# Altium project Martin_Smith_Project.PrjPcb (part 1 of 2)
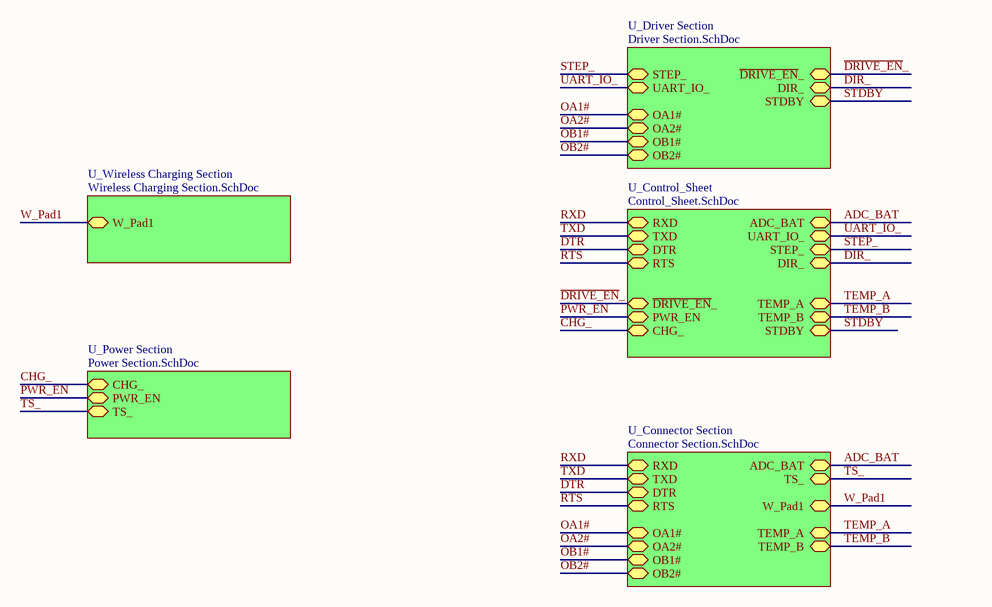
[diagram p0: Top Sheet.SchDoc]
6 sheets, 84 parts. Net scope: hierarchical (ports join the sheet entries above them; power ports are global).
Board file: MS_PCB.PcbDoc
Sheets:
  Top Sheet.SchDoc
    U_Power Section = Power Section.SchDoc
    U_Wireless Charging Section = Wireless Charging Section.SchDoc
    U_Connector Section = Connector Section.SchDoc
    U_Driver Section = Driver Section.SchDoc
    U_Control_Sheet = Control_Sheet.SchDoc

## Sheet Top Sheet.SchDoc
size A4; DocumentNumber: 1; SheetNumber: 1; SheetTotal: 6

### Sub-sheets
U_Connector Section = Connector Section.SchDoc: RXD (bidir), TXD (bidir), DTR (bidir), RTS (bidir), ADC_BAT (bidir), TS_ (bidir), W_Pad1 (bidir), TEMP_A (bidir), TEMP_B (bidir), OA2# (bidir), OB1# (bidir), OB2# (bidir), OA1# (bidir)
U_Control_Sheet = Control_Sheet.SchDoc: RXD (bidir), TXD (bidir), DTR (bidir), RTS (bidir), ADC_BAT (bidir), UART_IO_ (bidir), STEP_ (bidir), DIR_ (bidir), ~{DRI}~{VE_EN}_ (bidir), PWR_EN (bidir), CHG_ (bidir), TEMP_A (bidir), TEMP_B (bidir), STDBY (bidir)
U_Driver Section = Driver Section.SchDoc: STEP_ (bidir), DIR_ (bidir), UART_IO_ (bidir), ~{DRI}~{VE_EN}_ (bidir), STDBY (bidir), OB1# (bidir), OB2# (bidir), OA2# (bidir), OA1# (bidir)
U_Power Section = Power Section.SchDoc: PWR_EN (bidir), TS_ (bidir), CHG_ (bidir)
U_Wireless Charging Section = Wireless Charging Section.SchDoc: W_Pad1 (bidir)

### Nets
~{DRI}~{VE_EN}_: sheet U_Driver Section/~{DRI}~{VE_EN}_, sheet U_Control_Sheet/~{DRI}~{VE_EN}_
ADC_BAT: sheet U_Connector Section/ADC_BAT, sheet U_Control_Sheet/ADC_BAT
CHG_: sheet U_Power Section/CHG_, sheet U_Control_Sheet/CHG_
DIR_: sheet U_Driver Section/DIR_, sheet U_Control_Sheet/DIR_
DTR: sheet U_Connector Section/DTR, sheet U_Control_Sheet/DTR
OA1#: sheet U_Connector Section/OA1#, sheet U_Driver Section/OA1#
OA2#: sheet U_Connector Section/OA2#, sheet U_Driver Section/OA2#
OB1#: sheet U_Connector Section/OB1#, sheet U_Driver Section/OB1#
OB2#: sheet U_Connector Section/OB2#, sheet U_Driver Section/OB2#
PWR_EN: sheet U_Power Section/PWR_EN, sheet U_Control_Sheet/PWR_EN
RTS: sheet U_Connector Section/RTS, sheet U_Control_Sheet/RTS
RXD: sheet U_Connector Section/RXD, sheet U_Control_Sheet/RXD
STDBY: sheet U_Driver Section/STDBY, sheet U_Control_Sheet/STDBY
STEP_: sheet U_Driver Section/STEP_, sheet U_Control_Sheet/STEP_
TEMP_A: sheet U_Connector Section/TEMP_A, sheet U_Control_Sheet/TEMP_A
TEMP_B: sheet U_Connector Section/TEMP_B, sheet U_Control_Sheet/TEMP_B
TS_: sheet U_Power Section/TS_, sheet U_Connector Section/TS_
TXD: sheet U_Connector Section/TXD, sheet U_Control_Sheet/TXD
UART_IO_: sheet U_Driver Section/UART_IO_, sheet U_Control_Sheet/UART_IO_
W_Pad1: sheet U_Wireless Charging Section/W_Pad1, sheet U_Connector Section/W_Pad1

## Sheet Power Section.SchDoc
size A4; DocumentNumber: 2; SheetNumber: 2; SheetTotal: 6
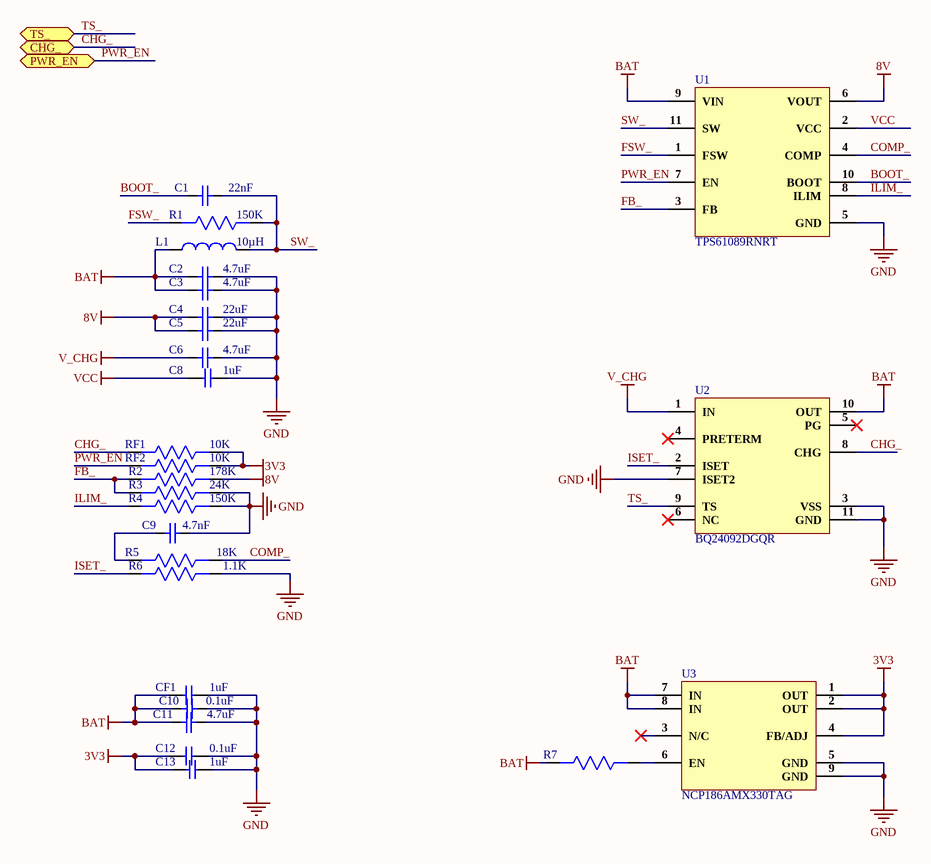
[diagram p1: Power Section.SchDoc]

### Parts
C1  22nF  [CAP 0201]
C2  4.7uF  [Cap0402]
C3  4.7uF  [Cap0402]
C4  22uF  [Cap0603]
C5  22uF  [Cap0603]
C6  4.7uF  [Cap0402]
C8  1uF  [CAP 0201]
C9  4.7nF  [Cap 0201]
C10  0.1uF  [CAP 0201]
C11  4.7uF  [Cap0402]
C12  0.1uF  [Cap 0201]
C13  1uF  [CAP 0201]
CF1  1uF  [Cap 0201]
L1  10µH  [SRN5040TA-100M]
R1  150K  [Res-0201]
R2  178K  [Res-0201]
R3  24K  [Res-0201]
R4  150K  [Res-0201]
R5  18K  [Res-0201]
R6  1.1K  [Res-0201]
R7  (no value)  [Res-0201]
RF1  10K  [Res-0201]
RF2  10K  [Res-0201]
U1  TPS61089RNRT  [TPS61089RNRT]
U2  BQ24092DGQR  [BQ24092DGQR]
U3  NCP186AMX330TAG  [NCP186AMX330TAG]

### Ports
CHG_ (bidir), PWR_EN (bidir), TS_ (bidir)

### Nets
3V3: C12.1 C13.1 RF1.1 RF2.1 U3.1(OUT) U3.2(OUT) U3.4(FB/ADJ)
8V: C4.2 C5.2 R2.1 U1.6(VOUT)
BAT: C2.2 C3.2 C10.2 C11.2 CF1.1 L1.1 R7.2 U1.9(VIN) U2.10(OUT) U3.7(IN) U3.8(IN)
GND: C2.1 C3.1 C4.1 C5.1 C6.1 C8.2 C9.1 C10.1 C11.1 C12.2 C13.2 CF1.2 R3.1 R4.1 R6.1 U1.5(GND) U2.3(VSS) U2.7(ISET2) U2.11(GND) U3.5(GND) U3.9(GND)
V_CHG: C6.2 U2.1(IN)
VCC: C8.1 U1.2(VCC)
BOOT_: C1.2 U1.10(BOOT)
CHG_: RF1.2 U2.8(CHG) ; port CHG_
COMP_: R5.1 U1.4(COMP)
FB_: R2.2 R3.2 U1.3(FB)
FSW_: R1.2 U1.1(FSW)
ILIM_: R4.2 U1.8(ILIM)
ISET_: R6.2 U2.2(ISET)
PWR_EN: RF2.2 U1.7(EN) ; port PWR_EN
SW_: C1.1 L1.2 R1.1 U1.11(SW)
TS_: U2.9(TS) ; port TS_
NetC9_2: C9.2 R5.2
NetR7_1: R7.1 U3.6(EN)

Not connected (* = marked no-connect by the designer): U2 4(PRETERM)* 5(PG)* 6(NC)*; U3 3(N/C)*

### Library data of the parts
C1 = TMK063BJ223KP-F: CAP CER 0.022UF 25V X5R 0201; Manufacturer: Taiyo Yuden; Tolerance: 10%; Supplier 1: Digi-Key; Manufacturer Part Number: TMK063BJ223KP-F; RoHS: No; Category: Ceramic Capacitors; Stock 1: 108943; Pricing 1: 1=0.10000, 10=0.02100, 50=0.01120, 100=0.00920, 500=0.00654, 1000=0.00514, 2500=0.00468, 5000=0.00430 (USD); Mount: Surface Mount; Case/Package: 0201; Case Code (Imperial): 0201; Case Code (Metric): 0603; Min Operating Temperature: -55°C; Max Operating Temperature: 85°C; Packaging: Tape and Reel; Capacitance: 22nF; Voltage Rating: 25V; ComponentLink1URL: https://ds.yuden.co.jp/TYCOMPAS/ut/detail?pn=TMK063BJ223KP-F &amp;u=M&src-supplier=Digi-Key; ComponentLink1Description: https://ds.yuden.co.jp/TYCOMPAS/ut/detail?pn=TMK063BJ223KP-F &amp;u=M&src-supplier=Digi-Key; ComponentLink2URL: http://ds.yuden.co.jp/TYCOMPAS/ut/detail.do?productNo=TMK063BJ223KP-F&amp;fileName=TMK063BJ223KP-F_SS&amp;mode=specSheetDownload&src-supplier=Digi-Key; ComponentLink2Description: http://ds.yuden.co.jp/TYCOMPAS/ut/detail.do?productNo=TMK063BJ223KP-F&amp;fileName=TMK063BJ223KP-F_SS&amp;mode=specSheetDownload&src-supplier=Digi-Key; Supplier Part Number 1: 587-6154-1-ND
C2 C3 C6 C11 = GRM155R61A475MEAAD: 0402 10 V 4.7 uF ±20% Tolerance X5R Multilayer Ceramic Chip Capacitor; Manufacturer: Murata; Voltage Rating: 10V; Supplier 1: Arrow Electronics; Manufacturer Part Number: GRM155R61A475MEAAD; Category: Ceramic Capacitors; Stock 1: 5; Pricing 1: 1=0.15280, 100000=0.02590, 1000000=0.02570, 10000000=0.02490 (USD); Mount: Surface Mount; Case/Package: 0402; Case Code (Imperial): 0402; Case Code (Metric): 1005; Min Operating Temperature: -55°C; Max Operating Temperature: 85°C; Packaging: Tape and Reel; Capacitance: 4.7uF; Tolerance: 20%; ComponentLink1URL: http://www.farnell.com/datasheets/2189109.pdf?src-supplier=Farnell; ComponentLink1Description: http://www.farnell.com/datasheets/2189109.pdf?src-supplier=Farnell; ComponentLink2URL: https://search.murata.co.jp/Ceramy/image/img/A01X/G101/ENG/GRM155R61A475MEAA-01.pdf?src-supplier=Digi-Key; ComponentLink2Description: https://search.murata.co.jp/Ceramy/image/img/A01X/G101/ENG/GRM155R61A475MEAA-01.pdf?src-supplier=Digi-Key; ComponentLink3URL: http://www.farnell.com/datasheets/2189109.pdf?src-supplier=Newark; ComponentLink3Description: http://www.farnell.com/datasheets/2189109.pdf?src-supplier=Newark; ComponentLink4URL: http://www.farnell.com/datasheets/2189109.pdf?src-supplier=Element14; ComponentLink4Description: http://www.farnell.com/datasheets/2189109.pdf?src-supplier=Element14; ComponentLink5URL: http://datasheet.octopart.com/GRM155R61A475MEAAD-Murata-datasheet-138740730.pdf?src-supplier=Ciiva+Crawler; ComponentLink5Description: http://datasheet.octopart.com/GRM155R61A475MEAAD-Murata-datasheet-138740730.pdf?src-supplier=Ciiva+Crawler; ComponentLink6URL: http://datasheet.octopart.com/GRM155R61A475MEAAD-Murata-datasheet-140690084.pdf?src-supplier=Ciiva+Crawler; ComponentLink6Description: http://datasheet.octopart.com/GRM155R61A475MEAAD-Murata-datasheet-140690084.pdf?src-supplier=Ciiva+Crawler; ComponentLink7URL: http://datasheet.octopart.com/GRM155R61A475MEAAD-Murata-datasheet-141266224.pdf?src-supplier=Ciiva+Crawler; ComponentLink7Description: http://datasheet.octopart.com/GRM155R61A475MEAAD-Murata-datasheet-141266224.pdf?src-supplier=Ciiva+Crawler; ComponentLink8URL: http://datasheet.octopart.com/GRM155R61A475MEAAD-Murata-datasheet-68589269.pdf?src-supplier=Newark; ComponentLink8Description: http://datasheet.octopart.com/GRM155R61A475MEAAD-Murata-datasheet-68589269.pdf?src-supplier=Newark; ComponentLink9URL: http://datasheet.octopart.com/GRM155R61A475MEAAD-Murata-datasheet-8819587.pdf; ComponentLink9Description: http://datasheet.octopart.com/GRM155R61A475MEAAD-Murata-datasheet-8819587.pdf; ComponentLink10URL: http://datasheet.octopart.com/GRM155R61A475MEAAD-Murata-datasheet-10025737.pdf; ComponentLink10Description: http://datasheet.octopart.com/GRM155R61A475MEAAD-Murata-datasheet-10025737.pdf; ComponentLink11URL: http://datasheet.octopart.com/GRM155R61A475MEAAD-Murata-datasheet-11978611.pdf; ComponentLink11Description: http://datasheet.octopart.com/GRM155R61A475MEAAD-Murata-datasheet-11978611.pdf; ComponentLink12URL: http://datasheet.octopart.com/GRM155R61A475MEAAD-Murata-datasheet-12510076.pdf; ComponentLink12Description: http://datasheet.octopart.com/GRM155R61A475MEAAD-Murata-datasheet-12510076.pdf; ComponentLink13URL: http://datasheet.octopart.com/GRM155R61A475MEAAD-Murata-datasheet-12515295.pdf; ComponentLink13Description: http://datasheet.octopart.com/GRM155R61A475MEAAD-Murata-datasheet-12515295.pdf; Supplier Part Number 1: GRM155R61A475MEAAD
C4 C5 = GRM187R61A226ME15D: CAP CER 22UF 10V X5R 0603; Manufacturer: Murata; Tolerance: 20%; Supplier 1: Digi-Key; Manufacturer Part Number: GRM187R61A226ME15D; RoHS: Yes; Category: Ceramic Capacitors; Stock 1: 93992; Pricing 1: 1=0.52000, 10=0.36500, 50=0.27580, 100=0.24030, 500=0.17798, 1000=0.15128 (USD); Mount: Surface Mount; Case/Package: 0603; Case Code (Imperial): 0603; Case Code (Metric): 1608; Min Operating Temperature: -55°C; Max Operating Temperature: 85°C; Dielectric: X5R; Voltage Rating (DC): 10V; Packaging: Tape and Reel; Capacitance: 22uF; Voltage Rating: 10V; Length: 0.063inch; Width: 0.031inch; Thickness: 0.031inch; ComponentLink1URL: http://search.murata.co.jp/Ceramy/image/img/A01X/G101/ENG/GRM187R61A226ME15-01.pdf?src-supplier=Digi-Key; ComponentLink1Description: http://search.murata.co.jp/Ceramy/image/img/A01X/G101/ENG/GRM187R61A226ME15-01.pdf?src-supplier=Digi-Key; Supplier Part Number 1: 490-13243-1-ND; RoHS Compliant: Yes
C8 C13 CF1 = CL03A105MO3NRNH: CAP CER 1UF 16V X5R 0201; Manufacturer: Samsung; Tolerance: 20%; Supplier 1: Digi-Key; Manufacturer Part Number: CL03A105MO3NRNH; RoHS: Yes; Category: Ceramic Capacitors; Mount: Surface Mount; Case/Package: 0201; Case Code (Metric): 0603; Case Code (Imperial): 0201; Min Operating Temperature: -55°C; Max Operating Temperature: 85°C; Packaging: Tape and Reel; Capacitance: 1uF; Voltage Rating: 16V; Length: 0.024inch; Width: 0.012inch; Thickness: 0.013inch; ComponentLink1URL: http://www.samsungsem.com/kr/support/product-search/mlcc/CL03A105MO3NRNH.jsp?src-supplier=Digi-Key; ComponentLink1Description: http://www.samsungsem.com/kr/support/product-search/mlcc/CL03A105MO3NRNH.jsp?src-supplier=Digi-Key; Supplier Part Number 1: 1276-6798-1-ND
  C8 C13: Stock 1: 66067; Pricing 1: 1=0.27000, 10=0.18500, 50=0.11080, 100=0.09360, 500=0.06406, 1000=0.05667, 2500=0.05421, 5000=0.04928 (USD); RoHS Compliant: Yes
  CF1: Stock 1: 1602977; Pricing 1: 1=0.28000, 10=0.19000, 50=0.11380, 100=0.09610, 500=0.06578, 1000=0.05819, 2500=0.05566, 5000=0.05060 (USD)
C9 = GRM033R61E472MA12D: CAP CER 4700PF 25V X5R 0201; Manufacturer: Murata; Tolerance: 20%; Supplier 1: Digi-Key; Manufacturer Part Number: GRM033R61E472MA12D; RoHS: Yes; Category: Ceramic Capacitors; Stock 1: 58014; Pricing 1: 1=0.10000, 10=0.01300, 50=0.00720, 100=0.00590, 500=0.00424, 1000=0.00333, 2500=0.00302, 5000=0.00278 (USD); Mount: Surface Mount; Case/Package: 0201; Case Code (Metric): 0603; Weight: 1.2E-05oz; Case Code (Imperial): 0201; Min Operating Temperature: -55°C; Max Operating Temperature: 85°C; Packaging: Tape and Reel; Voltage Rating: 25V; Capacitance: 4.7nF; Dielectric: X5R; Termination: SMD/SMT; Voltage Rating (DC): 25V; Package Quantity: 15000; Length: 0.024inch; Width: 0.3mm; Height: 0.3mm; Thickness: 0.013inch; ComponentLink1URL: http://www.mouser.com/ds/2/281/c02e-2905.pdf?src-supplier=Mouser; ComponentLink1Description: http://www.mouser.com/ds/2/281/c02e-2905.pdf?src-supplier=Mouser; ComponentLink2URL: http://search.murata.co.jp/Ceramy/image/img/A01X/partnumbering_e_01.pdf?src-supplier=Digi-Key; ComponentLink2Description: http://search.murata.co.jp/Ceramy/image/img/A01X/partnumbering_e_01.pdf?src-supplier=Digi-Key; ComponentLink3URL: http://search.murata.co.jp/Ceramy/image/img/A01X/G101/ENG/GRM033R61E472MA12-01.pdf?src-supplier=Digi-Key; ComponentLink3Description: http://search.murata.co.jp/Ceramy/image/img/A01X/G101/ENG/GRM033R61E472MA12-01.pdf?src-supplier=Digi-Key; Supplier Part Number 1: 490-9994-1-ND
C10 = GRM033R6YA104ME14D: CAP CER 0.1UF 35V X5R 0201; Manufacturer: Murata; Capacitance: 100nF; Tolerance: 20%; Supplier 1: Digi-Key; Manufacturer Part Number: GRM033R6YA104ME14D; RoHS: Yes; Category: Ceramic Capacitors; Stock 1: 173583; Pricing 1: 1=0.10000, 10=0.05100, 50=0.02780, 100=0.02260, 500=0.01616, 1000=0.01270, 2500=0.01155, 5000=0.01063 (USD); Mount: Surface Mount; Case/Package: 0201; Case Code (Metric): 0603; Case Code (Imperial): 0201; Weight: 1.2E-05oz; Min Operating Temperature: -55°C; Max Operating Temperature: 85°C; Packaging: Tape and Reel; Voltage Rating: 35V; Dielectric: X5R; Termination: SMD/SMT; Voltage Rating (DC): 35V; Package Quantity: 15000; Length: 0.024inch; Width: 0.012inch; Height: 0.3mm; Thickness: 0.013inch; RoHS Compliant: Yes; ComponentLink1URL: http://www.mouser.com/ds/2/281/c02e-2905.pdf?src-supplier=Mouser; ComponentLink1Description: http://www.mouser.com/ds/2/281/c02e-2905.pdf?src-supplier=Mouser; ComponentLink2URL: http://search.murata.co.jp/Ceramy/image/img/A01X/G101/ENG/GRM033R6YA104ME14-01.pdf?src-supplier=Digi-Key; ComponentLink2Description: http://search.murata.co.jp/Ceramy/image/img/A01X/G101/ENG/GRM033R6YA104ME14-01.pdf?src-supplier=Digi-Key; Supplier Part Number 1: 490-10431-1-ND
C12 = GRM033R6YA104ME14D: CAP CER 0.1UF 35V X5R 0201; Manufacturer: Murata; Tolerance: 20%; Capacitance: 100nF; Supplier 1: Digi-Key; Manufacturer Part Number: GRM033R6YA104ME14D; RoHS: Yes; Category: Ceramic Capacitors; Stock 1: 49800; Pricing 1: 1=0.10000, 10=0.05600, 50=0.03040, 100=0.02490, 500=0.01778, 1000=0.01398, 2500=0.01270, 5000=0.01169 (USD); Mount: Surface Mount; Case/Package: 0201; Weight: 1.2E-05oz; Case Code (Metric): 0603; Case Code (Imperial): 0201; Min Operating Temperature: -55°C; Max Operating Temperature: 85°C; Dielectric: X5R; Termination: SMD/SMT; Voltage Rating (DC): 35V; Package Quantity: 15000; Packaging: Tape and Reel; Voltage Rating: 35V; Length: 0.024inch; Height: 0.3mm; Width: 0.012inch; Thickness: 0.013inch; ComponentLink1URL: http://www.mouser.com/ds/2/281/c02e-2905.pdf?src-supplier=Mouser; ComponentLink1Description: http://www.mouser.com/ds/2/281/c02e-2905.pdf?src-supplier=Mouser; ComponentLink2URL: http://search.murata.co.jp/Ceramy/image/img/A01X/G101/ENG/GRM033R6YA104ME14-01.pdf?src-supplier=Digi-Key; ComponentLink2Description: http://search.murata.co.jp/Ceramy/image/img/A01X/G101/ENG/GRM033R6YA104ME14-01.pdf?src-supplier=Digi-Key; Supplier Part Number 1: 490-10431-1-ND
L1 = SRN5040TA-100M: Ind Power Wirewound 10uH 20% Ferrite Core T/R; Manufacturer: Bourns; Current Rating: 2.2A; Saturation Current: 2.52A; Shielding: Shielded; DC Resistance (DCR): 56mR; Self Resonant Frequency: 26MHz; Test Frequency: 100kHz; Supplier 1: Digi-Key; Manufacturer Part Number: SRN5040TA-100M; RoHS: No; Category: Fixed Inductors; Stock 1: 1454; Pricing 1: 1=0.52000, 10=0.45500, 25=0.42240, 50=0.35760, 100=0.32500, 250=0.30552, 500=0.27300 (USD); Mount: Surface Mount; Case/Package: Nonstandard; Core Material: Ferrite; Min Operating Temperature: -55°C; Max Operating Temperature: 125°C; Resistor Type: Wirewound; Packaging: Cut Tape; Inductance: 10uH; Tolerance: 20%; Ratings: AEC-Q200; ComponentLink1URL: http://www.farnell.com/datasheets/2675147.pdf?src-supplier=Farnell; ComponentLink1Description: http://www.farnell.com/datasheets/2675147.pdf?src-supplier=Farnell; ComponentLink2URL: https://www.bourns.com/docs/Product-Datasheets/SRN5040TA.pdf?src-supplier=Digi-Key; ComponentLink2Description: https://www.bourns.com/docs/Product-Datasheets/SRN5040TA.pdf?src-supplier=Digi-Key; ComponentLink3URL: http://www.farnell.com/datasheets/2675147.pdf?src-supplier=Newark; ComponentLink3Description: http://www.farnell.com/datasheets/2675147.pdf?src-supplier=Newark; Supplier Part Number 1: SRN5040TA-100MCT-ND
R1 R4 = RMCF0201FT150K: RES 150K OHM 1% 1/20W 0201; Manufacturer: Stackpole Electronics; Resistance: 150kR; Power Rating: 50mW; Temperature Coefficient: 200ppm/°C; Supplier 1: Digi-Key; Manufacturer Part Number: RMCF0201FT150K; RoHS: Yes; Category: Chip SMD Resistors; Stock 1: 71595; Pricing 1: 1=0.10000, 10=0.02300, 100=0.00940, 1000=0.00424, 2500=0.00368, 5000=0.00304 (USD); Mount: Surface Mount; Case/Package: 0201; Case Code (Metric): 0603; Case Code (Imperial): 0201; Contact Plating: Tin,Matte; Min Operating Temperature: -55°C; Max Operating Temperature: 125°C; Resistor Type: Thick Film; Package Quantity: 10000; Packaging: Tape and Reel; Tolerance: 1%; Number of Terminations: 2; Max Power Dissipation: 50mW; Length: 0.024inch; Width: 0.012inch; Height: 0.009inch; Radiation Hardening: No; ComponentLink1URL: https://www.seielect.com/catalog/SEI-RMCF_RMCP.pdf?src-supplier=Avnet+Asia; ComponentLink1Description: https://www.seielect.com/catalog/SEI-RMCF_RMCP.pdf?src-supplier=Avnet+Asia; ComponentLink2URL: https://www.seielect.com/catalog/SEI-RMCF_RMCP.pdf?src-supplier=Avnet; ComponentLink2Description: https://www.seielect.com/catalog/SEI-RMCF_RMCP.pdf?src-supplier=Avnet; ComponentLink3URL: http://www.seielect.com/Catalog/SEI-RMCF_RMCP.pdf?src-supplier=Digi-Key; ComponentLink3Description: http://www.seielect.com/Catalog/SEI-RMCF_RMCP.pdf?src-supplier=Digi-Key; ComponentLink4URL: https://www.seielect.com/Catalog/SEI-RMCF_RMCP.pdf?src-supplier=Digi-Key; ComponentLink4Description: https://www.seielect.com/Catalog/SEI-RMCF_RMCP.pdf?src-supplier=Digi-Key; ComponentLink5URL: https://www.seielect.com/catalog/SEI-Packaging.pdf?src-supplier=Digi-Key; ComponentLink5Description: https://www.seielect.com/catalog/SEI-Packaging.pdf?src-supplier=Digi-Key; Supplier Part Number 1: RMCF0201FT150KCT-ND
R2 = RC0201FR-07178KL: RES SMD 178K OHM 1% 1/20W 0201; Manufacturer: Yageo; Max Power Dissipation: 50mW; Temperature Coefficient: 200ppm/°C; Resistance: 178kR; Supplier 1: Digi-Key; Manufacturer Part Number: RC0201FR-07178KL; RoHS: Yes; Category: Chip SMD Resistors; Stock 1: 50010; Pricing 1: 1=0.10000, 10=0.03600, 100=0.01480, 1000=0.00665, 2500=0.00577, 5000=0.00477 (USD); Case/Package: 0201; Case Code (Imperial): 0201; Case Code (Metric): 0603; Min Operating Temperature: -55°C; Max Operating Temperature: 125°C; Tolerance: 1%; Packaging: Tape and Reel; Resistor Type: Thick Film; Number of Terminations: 2; Features: Moisture Resistant; Length: 0.024inch; Width: 0.012inch; Height: 0.01inch; ComponentLink1URL: http://www.yageo.com/documents/recent/PYu-RC_Group_51_RoHS_L_9.pdf?src-supplier=Digi-Key; ComponentLink1Description: http://www.yageo.com/documents/recent/PYu-RC_Group_51_RoHS_L_9.pdf?src-supplier=Digi-Key; ComponentLink2URL: http://www.yageo.com.tw/exep/pages/download/literatures/PYu-R_INT-thick_7.pdf?src-supplier=Digi-Key; ComponentLink2Description: http://www.yageo.com.tw/exep/pages/download/literatures/PYu-R_INT-thick_7.pdf?src-supplier=Digi-Key; Supplier Part Number 1: YAG2443CT-ND
R3 = RC0201JR-0724KL: RES SMD 24K OHM 5% 1/20W 0201; Manufacturer: Yageo; Power Rating: 50mW; Voltage Rating: 25V; Temperature Coefficient: 200ppm/°C; Resistance: 24kR; Supplier 1: Digi-Key; Manufacturer Part Number: RC0201JR-0724KL; RoHS: Yes; Category: Chip SMD Resistors; Stock 1: 16082; Pricing 1: 1=0.10000, 10=0.02600, 100=0.01040, 1000=0.00466, 2500=0.00405, 5000=0.00334 (USD); Case/Package: 0201; Weight: 6E-06oz; Case Code (Metric): 0603; Case Code (Imperial): 0201; Min Operating Temperature: -55°C; Max Operating Temperature: 125°C; Tolerance: 5%; Packaging: Tape and Reel; Termination: SMD/SMT; Length: 0.6mm; Width: 0.3mm; Height: 0.23mm; ComponentLink1URL: http://www.mouser.com/ds/2/447/PYu-RC_Group_51_RoHS_L_7-1101646.pdf?src-supplier=Mouser; ComponentLink1Description: http://www.mouser.com/ds/2/447/PYu-RC_Group_51_RoHS_L_7-1101646.pdf?src-supplier=Mouser; ComponentLink2URL: http://www.yageo.com/documents/recent/PYu-RC_Group_51_RoHS_L_10.pdf?src-supplier=Digi-Key; ComponentLink2Description: http://www.yageo.com/documents/recent/PYu-RC_Group_51_RoHS_L_10.pdf?src-supplier=Digi-Key; ComponentLink3URL: http://www.yageo.com/documents/recent/PYu-RC_Group_51_RoHS_L_9.pdf?src-supplier=Digi-Key; ComponentLink3Description: http://www.yageo.com/documents/recent/PYu-RC_Group_51_RoHS_L_9.pdf?src-supplier=Digi-Key; Supplier Part Number 1: 311-24KNCT-ND
R5 = RC0201FR-0718KL: RES SMD 18K OHM 1% 1/20W 0201; Manufacturer: Yageo; Resistance: 18kR; Power Rating: 50mW; Voltage Rating: 25V; Temperature Coefficient: 200ppm/°C; Supplier 1: Digi-Key; Manufacturer Part Number: RC0201FR-0718KL; RoHS: Yes; Category: Chip SMD Resistors; Stock 1: 12981; Pricing 1: 1=0.10000, 10=0.03600, 100=0.01480, 1000=0.00665, 2500=0.00577, 5000=0.00477 (USD); Case/Package: 0201; Case Code (Metric): 0603; Case Code (Imperial): 0201; Min Operating Temperature: -55°C; Max Operating Temperature: 125°C; Features: Moisture Resistant; Tolerance: 1%; Package Quantity: 1; Packaging: Tape and Reel; Max Power Dissipation: 50mW; Resistor Type: Thick Film; Number of Terminations: 2; Termination: SMD/SMT; Length: 0.024inch; Width: 0.012inch; Height: 0.01inch; Lead Free: Lead Free; REACH SVHC: No SVHC; ComponentLink1URL: https://datasheet.ciiva.com/2493/pyu-r-int-thick-7-2493817.pdf?src-supplier=Digi-Key; ComponentLink1Description: https://datasheet.ciiva.com/2493/pyu-r-int-thick-7-2493817.pdf?src-supplier=Digi-Key; ComponentLink2URL: https://datasheet.ciiva.com/2493/pyu-r-int-thick-7-2493818.pdf?src-supplier=Digi-Key; ComponentLink2Description: https://datasheet.ciiva.com/2493/pyu-r-int-thick-7-2493818.pdf?src-supplier=Digi-Key; ComponentLink3URL: https://datasheet.ciiva.com/2493/pyu-r-int-thick-7-2493819.pdf?src-supplier=Digi-Key; ComponentLink3Description: https://datasheet.ciiva.com/2493/pyu-r-int-thick-7-2493819.pdf?src-supplier=Digi-Key; ComponentLink4URL: https://datasheet.ciiva.com/22661/1563626-22661291.pdf?src-supplier=Element14; ComponentLink4Description: https://datasheet.ciiva.com/22661/1563626-22661291.pdf?src-supplier=Element14; Supplier Part Number 1: 311-18.0KMCT-ND
R6 = RC0201FR-071K1L: RES SMD 1.1K OHM 1% 1/20W 0201; Manufacturer: Yageo; Resistance: 1.1kR; Power Rating: 50mW; Temperature Coefficient: 200ppm/°C; Supplier 1: Digi-Key; Manufacturer Part Number: RC0201FR-071K1L; RoHS: Yes; Category: Chip SMD Resistors; Stock 1: 18736; Pricing 1: 1=0.10000, 10=0.03600, 100=0.01480, 1000=0.00665, 2500=0.00577, 5000=0.00477 (USD); Case/Package: 0201; Case Code (Metric): 0603; Case Code (Imperial): 0201; Min Operating Temperature: -55°C; Max Operating Temperature: 125°C; Tolerance: 1%; Packaging: Tape and Reel; Resistor Type: Thick Film; Number of Terminations: 2; Max Power Dissipation: 50mW; Features: Moisture Resistant; Length: 0.024inch; Width: 0.012inch; Height: 0.01inch; Lead Free: Lead Free; ComponentLink1URL: http://www.yageo.com/documents/recent/PYu-RC0201_51_RoHS_L_(8).pdf?src-supplier=Future+Electronics; ComponentLink1Description: http://www.yageo.com/documents/recent/PYu-RC0201_51_RoHS_L_(8).pdf?src-supplier=Future+Electronics; ComponentLink2URL: http://www.yageo.com.tw/exep/pages/download/literatures/PYu-R_INT-thick_7.pdf?src-supplier=Digi-Key; ComponentLink2Description: http://www.yageo.com.tw/exep/pages/download/literatures/PYu-R_INT-thick_7.pdf?src-supplier=Digi-Key; ComponentLink3URL: http://www.yageo.com/documents/recent/PYu-RC_Group_51_RoHS_L_9.pdf?src-supplier=Digi-Key; ComponentLink3Description: http://www.yageo.com/documents/recent/PYu-RC_Group_51_RoHS_L_9.pdf?src-supplier=Digi-Key; Supplier Part Number 1: YAG2474CT-ND
R7 RF1 RF2 = RC0201JR-0710KL: RES SMD 10K OHM 5% 1/20W 0201; Manufacturer: Yageo; Voltage Rating (DC): 25V; Power Rating: 50mW; Resistance: 10kR; Temperature Coefficient: 200ppm/°C; Case Code (Imperial): 0201; Case Code (Metric): 0603; Case/Package: 0201; Category: Chip SMD Resistors; Contact Plating: Tin,Matte; Depth: 0.3mm; Lead Free: Lead Free; Length: 0.6mm; Manufacturer Part Number: RC0201JR-0710KL; Max Operating Temperature: 125°C; Military Standard: Not; Min Operating Temperature: -55°C; Packaging: Tape and Reel; Radiation Hardening: No; REACH SVHC: Unknown; Resistor Type: Thick Film; Termination: SMD/SMT; Tolerance: 5%; Voltage Rating: 25V; ComponentLink1Description: New link; ComponentLink1URL: *; Supplier 1: Digi-Key; RoHS: Yes; Stock 1: 1488597; Pricing 1: 1=0.10000, 10=0.02600, 100=0.01050, 1000=0.00472, 2500=0.00410, 5000=0.00338 (USD); ComponentLink2URL: https://datasheet.ciiva.com/8891/pyu-rc0201-51-rohs-l-8-8891388.pdf?src-supplier=Avnet; ComponentLink2Description: https://datasheet.ciiva.com/8891/pyu-rc0201-51-rohs-l-8-8891388.pdf?src-supplier=Avnet; ComponentLink3URL: https://datasheet.ciiva.com/7672/1563626-7672253.pdf?src-supplier=Element14; ComponentLink3Description: https://datasheet.ciiva.com/7672/1563626-7672253.pdf?src-supplier=Element14; ComponentLink4URL: https://datasheet.ciiva.com/28405/pyu-rc0201-51-rohs-l-8-28405613.pdf?src-supplier=Avnet+Europe; ComponentLink4Description: https://datasheet.ciiva.com/28405/pyu-rc0201-51-rohs-l-8-28405613.pdf?src-supplier=Avnet+Europe; ComponentLink5URL: https://datasheet.ciiva.com/7672/1563626-7672254.pdf?src-supplier=Element14; ComponentLink5Description: https://datasheet.ciiva.com/7672/1563626-7672254.pdf?src-supplier=Element14; ComponentLink6URL: https://datasheet.ciiva.com/7660/1421516-7660810.pdf?src-supplier=Element14; ComponentLink6Description: https://datasheet.ciiva.com/7660/1421516-7660810.pdf?src-supplier=Element14; ComponentLink7URL: https://datasheet.ciiva.com/16856/pyu-rc0201-51-rohs-l-8-16856011.pdf?src-supplier=Avnet+Europe; ComponentLink7Description: https://datasheet.ciiva.com/16856/pyu-rc0201-51-rohs-l-8-16856011.pdf?src-supplier=Avnet+Europe; ComponentLink8URL: https://datasheet.ciiva.com/46391/1421516-46391291.pdf?src-supplier=Element14; ComponentLink8Description: https://datasheet.ciiva.com/46391/1421516-46391291.pdf?src-supplier=Element14; Supplier Part Number 1: 311-10KNCT-ND
U1 = TPS61089RNRT: IC REG BOOST ADJ 7A 11VQFN; Manufacturer: Texas Instruments; Quiescent Current: 10uA; Supplier 1: Digi-Key; Manufacturer Part Number: TPS61089RNRT; RoHS: No; Category: Voltage Regulators - Switching; Pricing 1: 1=2.95000, 10=2.64900, 25=2.50440, 100=2.05910 (USD); Min Operating Temperature: -40°C; Max Operating Temperature: 85°C; Topology: Boost; Lead Free: Lead Free; ComponentLink1URL: http://www.ti.com/lit/ds/symlink/tps61089.pdf?src-supplier=Digi-Key; ComponentLink1Description: http://www.ti.com/lit/ds/symlink/tps61089.pdf?src-supplier=Digi-Key; ComponentLink2URL: http://www.ti.com/general/docs/suppproductinfo.tsp?distId=10&amp;gotoUrl=http%3A%2F%2Fwww.ti.com%2Flit%2Fgpn%2Ftps61089&src-supplier=Digi-Key; ComponentLink2Description: http://www.ti.com/general/docs/suppproductinfo.tsp?distId=10&amp;gotoUrl=http%3A%2F%2Fwww.ti.com%2Flit%2Fgpn%2Ftps61089&src-supplier=Digi-Key; Supplier Part Number 1: 296-46242-1-ND
U2 = BQ24092DGQR: IC BATT CHG LI-ION 1CELL 10MSOP; Manufacturer: Texas Instruments; Output Current: 1A; Min Supply Voltage: 3.5V; Max Supply Voltage: 6.45V; Output Voltage: 4.2V; Min Input Voltage: 4.5V; Number of Cells: 1; Interface: USB; Fault Protection: Over Voltage,Over Temperature,Short Circuit; Supplier 1: Digi-Key; Manufacturer Part Number: BQ24092DGQR; RoHS: Yes; Category: Battery Management; Stock 1: 52631; Pricing 1: 1=1.29000, 10=1.15100, 25=1.09200, 100=0.83850, 250=0.74100, 500=0.70200, 1000=0.54600 (USD); Case/Package: HTSSOP EP; Number of Pins: 10; Contact Plating: Gold; Min Operating Temperature: -40°C; Max Operating Temperature: 125°C; Packaging: Tape and Reel; Package Quantity: 2500; Max Charge Current: 1A; Battery Pack Voltage: 4.2V; Radiation Hardening: No; Lead Free: Lead Free; ComponentLink1URL: https://datasheet.ciiva.com/15114/getdatasheetpartid-516671-15114858.pdf?src-supplier=Verical; ComponentLink1Description: https://datasheet.ciiva.com/15114/getdatasheetpartid-516671-15114858.pdf?src-supplier=Verical; ComponentLink2URL: https://datasheet.ciiva.com/1934/bq24092-1934314.pdf?src-supplier=Digi-Key; ComponentLink2Description: https://datasheet.ciiva.com/1934/bq24092-1934314.pdf?src-supplier=Digi-Key; ComponentLink3URL: https://datasheet.ciiva.com/3214/bq24092-3214092.pdf?src-supplier=Avnet; ComponentLink3Description: https://datasheet.ciiva.com/3214/bq24092-3214092.pdf?src-supplier=Avnet; Supplier Part Number 1: 296-41204-1-ND
U3 = NCP186AMX330TAG: IC REG LINEAR 3.3V 1A 8XDFN; Manufacturer: ON Semiconductor; Dropout Voltage: 95mV; Number of Regulators: 1; Min Current Limit: 1.1A; Supplier 1: Digi-Key; Manufacturer Part Number: NCP186AMX330TAG; Stock 1: 5995; Pricing 1: 1=0.48, 10=0.39, 25=0.3564, 100=0.2405, 250=0.199, 500=0.18242, 1000=0.13682 (USD); Mount: Surface Mount; Number of Pins: 8; Min Operating Temperature: -40°C; Max Operating Temperature: 125°C; Packaging: Tape and Reel; Output Voltage: 3.3V; Output Current: 1A; Lead Free: Lead Free; ComponentLink1URL: http://www.farnell.com/datasheets/2236905.pdf?src-supplier=Farnell; ComponentLink1Description: http://www.farnell.com/datasheets/2236905.pdf?src-supplier=Farnell; ComponentLink2URL: http://www.farnell.com/datasheets/2236905.pdf?src-supplier=Newark; ComponentLink2Description: http://www.farnell.com/datasheets/2236905.pdf?src-supplier=Newark; ComponentLink3URL: http://www.onsemi.com/pub/Collateral/NCP186-D.PDF?src-supplier=Digi-Key; ComponentLink3Description: http://www.onsemi.com/pub/Collateral/NCP186-D.PDF?src-supplier=Digi-Key; ComponentLink4URL: https://www.onsemi.com/pub/Collateral/NCP186-D.PDF?src-supplier=Digi-Key; ComponentLink4Description: https://www.onsemi.com/pub/Collateral/NCP186-D.PDF?src-supplier=Digi-Key; Supplier Part Number 1: NCP186AMX330TAGOSCT-ND

## Sheet Wireless Charging Section.SchDoc
size A; DocumentNumber: 3; SheetNumber: 3; SheetTotal: 6
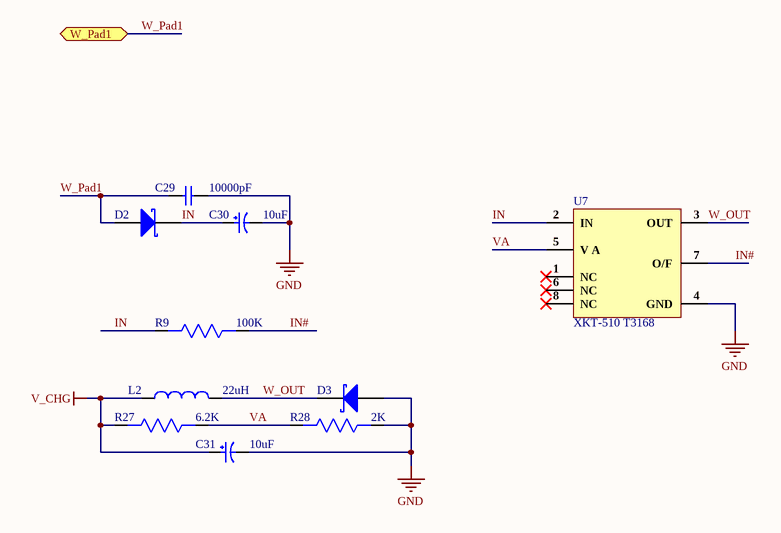
[diagram p2: Wireless Charging Section.SchDoc]

### Parts
C29  10000pF  [CAP 0201]
C30  10uF  [Cap Case-C]
C31  10uF  [Cap Case-C]
D2  SS34  [SMC]  (value not drawn)
D3  SS34  [SMC]  (value not drawn)
L2  22uH  [SRU8028-220Y]
R9  100K  [Res-0201]
R27  6.2K  [Res-0201]
R28  2K  [Res-0201]
U7  XKT-510 T3168  [SOP-8]

### Ports
W_Pad1 (bidir)

### Nets
GND: C29.2 C30.1 C31.1 D3.1(A) R28.1 U7.4(GND)
V_CHG: C31.2 L2.1 R27.2
IN: C30.2 D2.2(K) R9.2 U7.2(IN)
IN#: R9.1 U7.7(O/F)
VA: R27.1 R28.2 U7.5(V_A)
W_OUT: D3.2(K) L2.2 U7.3(OUT)
W_Pad1: C29.1 D2.1(A) ; port W_Pad1

Not connected (* = marked no-connect by the designer): U7 1(NC)* 6(NC)* 8(NC)*

### Library data of the parts
C29 = CC0201KRX7R8BB103: CAP CER X7R 0201; Manufacturer: Yageo; Supplier 1: Digi-Key; Manufacturer Part Number: CC0201KRX7R8BB103; RoHS: Yes; Stock 1: 19600; Pricing 1: 1=0.10000, 10=0.02800, 50=0.01520, 100=0.01240, 500=0.00886, 1000=0.00696, 2500=0.00632, 5000=0.00582 (USD); RoHS Compliant: Yes; Supplier Part Number 1: 13-CC0201KRX7R8BB103CT-ND
C30 C31 = 293D106X0025C2TE3: CAP TANT 10UF 20% 25V 2312; Manufacturer: Vishay Sprague; Dielectric Material: Tantalum; ESR (Equivalent Series Resistance): 1.5R; Ripple Current: 190mA; Leakage Current: 2.5uA; Polarity: Polar; Dissipation Factor: 6%; Supplier 1: Digi-Key; Manufacturer Part Number: 293D106X0025C2TE3; RoHS: Yes; Category: Tantalum Capacitors; Stock 1: 14194; Pricing 1: 1=0.45000, 10=0.31600, 50=0.23920, 100=0.20840 (USD); Mount: Surface Mount,PCB; Case/Package: Molded; Number of Pins: 2; Case Code (Metric): 6032; Case Code (Imperial): 2312; Min Operating Temperature: -55°C; Max Operating Temperature: 125°C; Capacitance: 10uF; Tolerance: 20%; Package Quantity: 1; Voltage Rating: 25V; Packaging: Tape and Reel; Voltage Rating (DC): 25V; Termination: SMD/SMT; Features: General Purpose; Series: TANTAMOUNT® 293D; Construction: Flat; Length: 6mm; Width: 0.126inch; Height: 2.5mm; Depth: 3.2mm; Height - Seated (Max): 0.11inch; Radiation Hardening: No; REACH SVHC: Unknown; Lead Free: Lead Free; RoHS Compliant: Yes; ComponentLink1URL: https://datasheet.ciiva.com/258/293d-258835.pdf?src-supplier=Digi-Key; ComponentLink1Description: https://datasheet.ciiva.com/258/293d-258835.pdf?src-supplier=Digi-Key; ComponentLink2URL: https://datasheet.ciiva.com/15163/getdatasheetpartid-87477-15163227.pdf?src-supplier=Verical; ComponentLink2Description: https://datasheet.ciiva.com/15163/getdatasheetpartid-87477-15163227.pdf?src-supplier=Verical; ComponentLink3URL: https://datasheet.ciiva.com/16508/293d-16508059.pdf?src-supplier=Future+Electronics; ComponentLink3Description: https://datasheet.ciiva.com/16508/293d-16508059.pdf?src-supplier=Future+Electronics; ComponentLink4URL: https://datasheet.ciiva.com/3003/293d-3003820.pdf?src-supplier=Avnet; ComponentLink4Description: https://datasheet.ciiva.com/3003/293d-3003820.pdf?src-supplier=Avnet; ComponentLink5URL: https://datasheet.ciiva.com/18444/70212567-18444876.pdf?src-supplier=Allied+Electronics; ComponentLink5Description: https://datasheet.ciiva.com/18444/70212567-18444876.pdf?src-supplier=Allied+Electronics; ComponentLink6URL: https://datasheet.ciiva.com/46382/1796648-46382044.pdf?src-supplier=Element14; ComponentLink6Description: https://datasheet.ciiva.com/46382/1796648-46382044.pdf?src-supplier=Element14; ComponentLink7URL: https://datasheet.ciiva.com/11244/293d-11244094.pdf?src-supplier=Avnet; ComponentLink7Description: https://datasheet.ciiva.com/11244/293d-11244094.pdf?src-supplier=Avnet; ComponentLink8URL: https://datasheet.ciiva.com/16631/293d-16631759.pdf?src-supplier=Avnet+Europe; ComponentLink8Description: https://datasheet.ciiva.com/16631/293d-16631759.pdf?src-supplier=Avnet+Europe; ComponentLink9URL: https://datasheet.ciiva.com/258/293d-258834.pdf?src-supplier=Digi-Key; ComponentLink9Description: https://datasheet.ciiva.com/258/293d-258834.pdf?src-supplier=Digi-Key; ComponentLink10URL: https://datasheet.ciiva.com/258/293d-258836.pdf?src-supplier=Digi-Key; ComponentLink10Description: https://datasheet.ciiva.com/258/293d-258836.pdf?src-supplier=Digi-Key; ComponentLink11URL: https://datasheet.ciiva.com/12884/293d-239871-12884366.pdf?src-supplier=Mouser; ComponentLink11Description: https://datasheet.ciiva.com/12884/293d-239871-12884366.pdf?src-supplier=Mouser; Supplier Part Number 1: 718-1044-1-ND
D2 D3 = SS34: DIODE SCHOTTKY 40V 3A DO214AB; Manufacturer: Vishay Semiconductors; Manufacturer Part Number: SS34-E3/57T; Element Configuration: Single; Max Forward Surge Current (Ifsm): 100A; Max Reverse Current: 500uA; Forward Voltage: 500mV; Polarity: Standard; Supplier 1: Digi-Key; RoHS: Yes; Category: Rectifier Diodes; Stock 1: 17665; Pricing 1: 1=0.53000, 10=0.45400, 100=0.31530 (USD); Mount: Surface Mount; Case/Package: SMC; Number of Pins: 2; Contact Plating: Tin,Matte; Min Operating Temperature: -55°C; Max Operating Temperature: 125°C; Packaging: Tape and Reel; Package Quantity: 1; Max Repetitive Reverse Voltage (Vrrm): 40V; Current Rating: 3A; Forward Current: 3A; Voltage Rating (DC): 40V; Output Current: 3A; Peak Non-Repetitive Surge Current: 100A; Average Rectified Current: 3A; Max Reverse Voltage (DC): 40V; Max Surge Current: 100A; Max Reverse Leakage Current: 500uA; Current: 3A; Voltage: 40V; Length: 7.11mm; Width: 6.22mm; Height: 2.417mm; Radiation Hardening: No; REACH SVHC: Unknown; Lead Free: Lead Free; Supplier Part Number 1: SS34-E3/57TGICT-ND
L2 = SRU8028-220Y: FIXED IND 22UH 1.6A 106 MOHM SMD; Manufacturer: Bourns; Core Material: Ferrite; Tolerance: 30%; DC Resistance (DCR): 106mR; Self Resonant Frequency: 20MHz; Saturation Current: 1.5A; Shielding: Shielded; Test Frequency: 100kHz; Q Factor: 22; Current: 2.8A; Supplier 1: Digi-Key; Manufacturer Part Number: SRU8028-220Y; RoHS: Yes; Category: Fixed Inductors; Stock 1: 1920; Pricing 1: 1=0.92000, 10=0.85800, 25=0.79200, 50=0.66000, 100=0.62040, 250=0.55440, 500=0.47520 (USD); Mount: Surface Mount; Case/Package: 8028; Number of Pins: 2; Min Operating Temperature: -40°C; Max Operating Temperature: 125°C; Inductance: 22uH; Max DC Current: 1.6A; Packaging: Tape and Reel; Inductance Tolerance: 30%; Package Quantity: 1500; Current Rating: 1.6A; Resistor Type: Wirewound; RMS Current (Irms): 1.6A; Termination: SMD/SMT; DC Current: 1.6A; Series: SRU8028; Length: 0.315inch; Width: 0.315inch; Height: 2.8mm; Height - Seated (Max): 0.122inch; Depth: 8.3mm; Military Standard: Not; REACH SVHC: No SVHC; RoHS Compliant: Yes; ComponentLink1URL: https://datasheet.ciiva.com/3866/41849355s8208904n1506-3866094.pdf?src-supplier=Avnet; ComponentLink1Description: https://datasheet.ciiva.com/3866/41849355s8208904n1506-3866094.pdf?src-supplier=Avnet; ComponentLink2URL: https://datasheet.ciiva.com/3866/41849355s8208904n1506-3866094.pdf?src-supplier=Arrow+Electronics; ComponentLink2Description: https://datasheet.ciiva.com/3866/41849355s8208904n1506-3866094.pdf?src-supplier=Arrow+Electronics; ComponentLink3URL: https://datasheet.ciiva.com/7848/sru8028-7848101.pdf?src-supplier=Element14; ComponentLink3Description: https://datasheet.ciiva.com/7848/sru8028-7848101.pdf?src-supplier=Element14; ComponentLink4URL: https://datasheet.ciiva.com/6691/sru8028-6691830.pdf?src-supplier=Digi-Key; ComponentLink4Description: https://datasheet.ciiva.com/6691/sru8028-6691830.pdf?src-supplier=Digi-Key; ComponentLink5URL: https://datasheet.ciiva.com/7848/1776946-7848102.pdf?src-supplier=Element14; ComponentLink5Description: https://datasheet.ciiva.com/7848/1776946-7848102.pdf?src-supplier=Element14; ComponentLink6URL: https://datasheet.ciiva.com/6691/sru8028-6691834.pdf?src-supplier=Digi-Key; ComponentLink6Description: https://datasheet.ciiva.com/6691/sru8028-6691834.pdf?src-supplier=Digi-Key; ComponentLink7URL: https://datasheet.ciiva.com/6691/sru8028-6691836.pdf?src-supplier=Digi-Key; ComponentLink7Description: https://datasheet.ciiva.com/6691/sru8028-6691836.pdf?src-supplier=Digi-Key; ComponentLink8URL: https://datasheet.ciiva.com/6161/sru8028-6161214.pdf?src-supplier=Farnell; ComponentLink8Description: https://datasheet.ciiva.com/6161/sru8028-6161214.pdf?src-supplier=Farnell; ComponentLink9URL: https://datasheet.ciiva.com/17285/sru8028-17285550.pdf?src-supplier=Avnet+Europe; ComponentLink9Description: https://datasheet.ciiva.com/17285/sru8028-17285550.pdf?src-supplier=Avnet+Europe; Supplier Part Number 1: SRU8028-220YCT-ND
R9 = RC0201FR-07100KL: RES SMD 100K OHM 1% 1/20W 0201; Manufacturer: Yageo; Resistance: 100kR; Power Rating: 50mW; Voltage Rating: 25V; Temperature Coefficient: 200ppm/°C; ComponentLink1URL: http://www.yageo.com/documents/recent/PYu-RC_Group_51_RoHS_L_9.pdf?src-supplier=Digi-Key; ComponentLink1Description: http://www.yageo.com/documents/recent/PYu-RC_Group_51_RoHS_L_9.pdf?src-supplier=Digi-Key; ComponentLink2URL: http://www.yageo.com.tw/exep/pages/download/literatures/PYu-R_INT-thick_7.pdf?src-supplier=Digi-Key; ComponentLink2Description: http://www.yageo.com.tw/exep/pages/download/literatures/PYu-R_INT-thick_7.pdf?src-supplier=Digi-Key; Supplier 1: Digi-Key; Manufacturer Part Number: RC0201FR-07100KL; Stock 1: 2817321; Pricing 1: 1=0.1, 10=0.036, 100=0.0148, 1000=0.0067, 2500=0.0058, 5000=0.0048 (USD); Case/Package: 0201; Number of Pins: 2; Case Code (Imperial): 0201; Case Code (Metric): 0603; Contact Plating: Tin,Matte; Size Code: 0201; Min Operating Temperature: -55°C; Max Operating Temperature: 125°C; Tolerance: 1%; Packaging: Tape and Reel; Package Quantity: 10000; Termination: SMD/SMT; Resistor Type: Thick Film; Number of Terminations: 2; Max Power Dissipation: 50mW; Voltage Rating (DC): 25V; Features: Moisture Resistant; Series: RC; Resistance Tolerance: 1%; Construction: Rectangular; Length: 0.024inch; Width: 0.012inch; Height: 0.01inch; Depth: 0.3mm; REACH SVHC: No SVHC; Military Standard: Not; Lead Free: Lead Free; RoHS Compliant: Yes; ComponentLink3URL: http://www.farnell.com/datasheets/2167052.pdf?src-supplier=Element14; ComponentLink3Description: http://www.farnell.com/datasheets/2167052.pdf?src-supplier=Element14; ComponentLink4URL: http://www.yageo.com/documents/recent/PYu-RC_Group_51_RoHS_L_10.pdf?src-supplier=Digi-Key; ComponentLink4Description: http://www.yageo.com/documents/recent/PYu-RC_Group_51_RoHS_L_10.pdf?src-supplier=Digi-Key; ComponentLink5URL: https://www.verical.com/server-webapp/html/getDatasheet?partID=420441&src-supplier=Verical; ComponentLink5Description: https://www.verical.com/server-webapp/html/getDatasheet?partID=420441&src-supplier=Verical; ComponentLink6URL: http://www.farnell.com/datasheets/1421516.pdf?src-supplier=Element14; ComponentLink6Description: http://www.farnell.com/datasheets/1421516.pdf?src-supplier=Element14; ComponentLink7URL: http://www.yageo.com/documents/recent/PYu-RC0201_51_RoHS_L_8.pdf?src-supplier=Avnet+Europe; ComponentLink7Description: http://www.yageo.com/documents/recent/PYu-RC0201_51_RoHS_L_8.pdf?src-supplier=Avnet+Europe; Supplier Part Number 1: 311-100KMCT-ND
R27 = RMCF0201JT6K20: RES 6.2K OHM 5% 1/20W 0201; Manufacturer: Stackpole Electronics; Resistance: 6.2kR; Max Power Dissipation: 50mW; Temperature Coefficient: 200ppm/°C; Supplier 1: Digi-Key; Manufacturer Part Number: RMCF0201JT6K20; RoHS: Yes; Category: Chip SMD Resistors; Stock 1: 8800; Pricing 1: 1=0.10000, 10=0.01700, 100=0.00710, 1000=0.00318, 2500=0.00276, 5000=0.00228 (USD); Mount: Surface Mount; Case/Package: 0201; Case Code (Metric): 0603; Case Code (Imperial): 0201; Contact Plating: Tin,Matte; Min Operating Temperature: -55°C; Max Operating Temperature: 125°C; Packaging: Tape and Reel; Tolerance: 5%; Resistor Type: Thick Film; Number of Terminations: 2; Series: RMCF; Length: 0.024inch; Width: 0.012inch; Height: 0.009inch; Radiation Hardening: No; RoHS Compliant: Yes; ComponentLink1URL: https://www.seielect.com/catalog/SEI-RMCF_RMCP.pdf?src-supplier=Avnet; ComponentLink1Description: https://www.seielect.com/catalog/SEI-RMCF_RMCP.pdf?src-supplier=Avnet; ComponentLink2URL: https://www.seielect.com/Catalog/SEI-RMCF_RMCP.pdf?src-supplier=Digi-Key; ComponentLink2Description: https://www.seielect.com/Catalog/SEI-RMCF_RMCP.pdf?src-supplier=Digi-Key; ComponentLink3URL: https://www.seielect.com/catalog/SEI-Packaging.pdf?src-supplier=Digi-Key; ComponentLink3Description: https://www.seielect.com/catalog/SEI-Packaging.pdf?src-supplier=Digi-Key; Supplier Part Number 1: RMCF0201JT6K20CT-ND
R28 = RMCF0201JT2K00: RES 2K OHM 5% 1/20W 0201; Manufacturer: Stackpole Electronics; Resistance: 2kR; Power Rating: 50mW; Temperature Coefficient: 200ppm/°C; Supplier 1: Digi-Key; Manufacturer Part Number: RMCF0201JT2K00; RoHS: Yes; Category: Chip SMD Resistors; Stock 1: 15230; Pricing 1: 1=0.10000, 10=0.01700, 100=0.00710, 1000=0.00318, 2500=0.00276, 5000=0.00228 (USD); Mount: Surface Mount; Case/Package: 0201; Case Code (Metric): 0603; Case Code (Imperial): 0201; Contact Plating: Tin,Matte; Min Operating Temperature: -55°C; Max Operating Temperature: 125°C; Packaging: Tape and Reel; Tolerance: 5%; Resistor Type: Thick Film; Number of Terminations: 2; Max Power Dissipation: 50mW; Series: RMCF; Length: 0.024inch; Width: 0.012inch; Height: 0.009inch; Radiation Hardening: No; RoHS Compliant: Yes; ComponentLink1URL: https://www.seielect.com/catalog/SEI-RMCF_RMCP.pdf?src-supplier=Avnet; ComponentLink1Description: https://www.seielect.com/catalog/SEI-RMCF_RMCP.pdf?src-supplier=Avnet; ComponentLink2URL: https://www.seielect.com/Catalog/SEI-RMCF_RMCP.pdf?src-supplier=Digi-Key; ComponentLink2Description: https://www.seielect.com/Catalog/SEI-RMCF_RMCP.pdf?src-supplier=Digi-Key; ComponentLink3URL: https://www.seielect.com/catalog/SEI-RMCF_RMCP.pdf?src-supplier=Avnet+Asia; ComponentLink3Description: https://www.seielect.com/catalog/SEI-RMCF_RMCP.pdf?src-supplier=Avnet+Asia; Supplier Part Number 1: RMCF0201JT2K00CT-ND
U7 = XKT-510 T3168: Wireless charging receiver IC Receive universal IC; Manufacturer: *; Manufacturer Part No: XKT-510 T3168; Value: *; Package: SOP 8